# Altium schematic sheet placement.SchDoc
size 254 x 203 mm
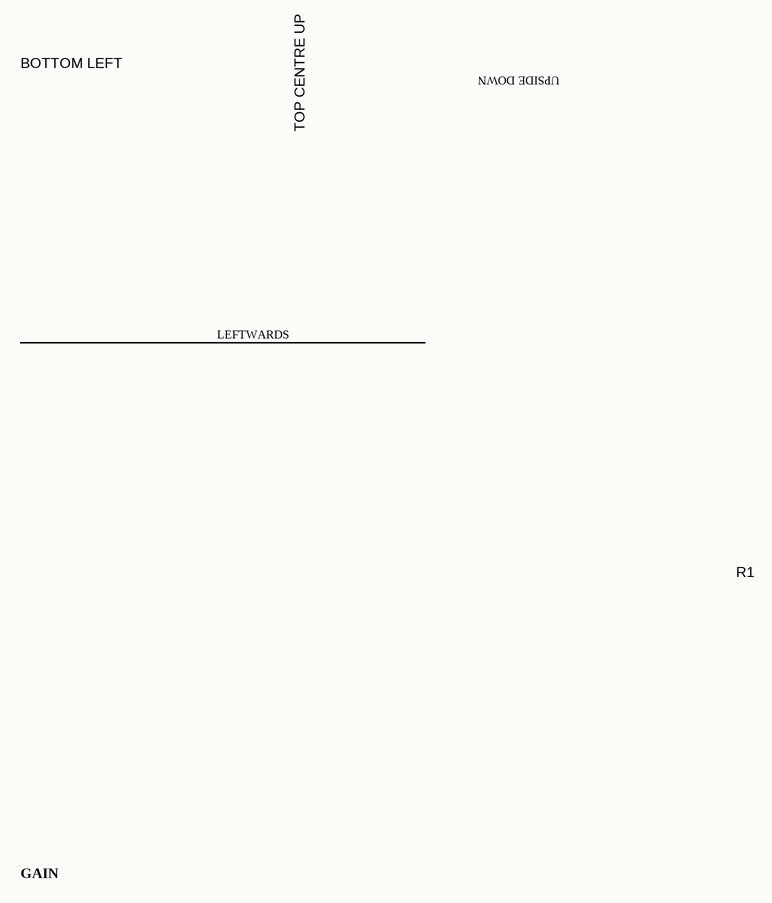
[diagram p0: placement.SchDoc]

## Parts
R1  (no value)

## Notes on the sheet
- BOTTOM LEFT
- TOP CENTRE UP
- UPSIDE DOWN
- GAIN

## Library data of the parts
R1 = Resistor